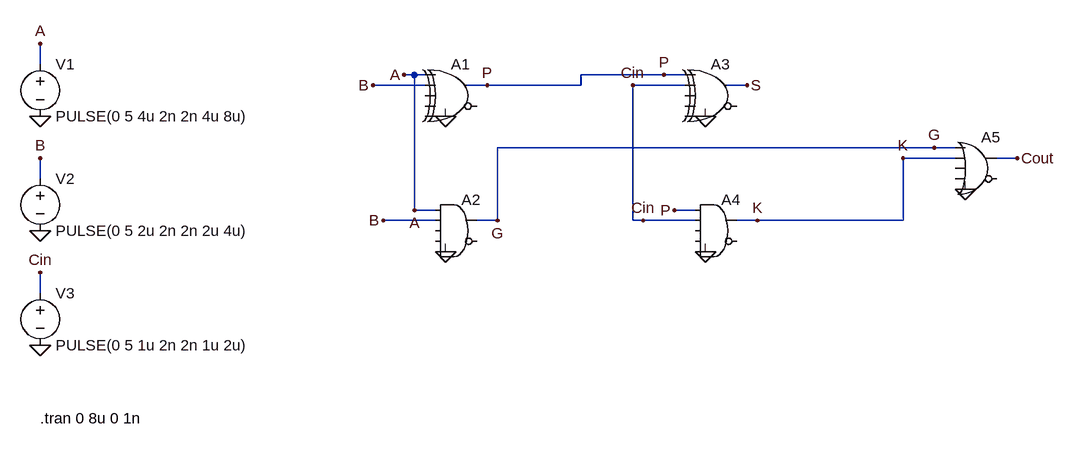
[diagram p0: schematic full_adder.asc]
full_adder.asc, the LTspice schematic file:
Version 4.1
SHEET 1 1904 784
WIRE -640 16 -640 -16
WIRE -64 32 -80 32
WIRE -48 32 -64 32
WIRE 320 32 192 32
WIRE 352 32 320 32
WIRE -48 48 -128 48
WIRE 48 48 16 48
WIRE 192 48 192 32
WIRE 192 48 48 48
WIRE 352 48 272 48
WIRE 448 48 416 48
WIRE 736 144 64 144
WIRE 768 144 736 144
WIRE 768 160 688 160
WIRE 864 160 832 160
WIRE -640 192 -640 160
WIRE -64 240 -64 32
WIRE -32 240 -64 240
WIRE 368 240 336 240
WIRE -32 256 -112 256
WIRE 64 256 64 144
WIRE 64 256 32 256
WIRE 272 256 272 48
WIRE 288 256 272 256
WIRE 368 256 288 256
WIRE 464 256 432 256
WIRE 688 256 688 160
WIRE 688 256 464 256
WIRE -640 368 -640 336
FLAG -640 -16 A
FLAG -640 96 0
FLAG -640 160 B
FLAG -640 272 0
FLAG -640 336 Cin
FLAG -640 448 0
FLAG -80 32 A
FLAG -128 48 B
FLAG -16 96 0
FLAG 48 48 P
FLAG -64 240 A
FLAG -112 256 B
FLAG -16 304 0
FLAG 64 256 G
FLAG 320 32 P
FLAG 272 48 Cin
FLAG 384 96 0
FLAG 448 48 S
FLAG 336 240 P
FLAG 288 256 Cin
FLAG 384 304 0
FLAG 464 256 K
FLAG 736 144 G
FLAG 688 160 K
FLAG 784 208 0
FLAG 864 160 Cout
SYMBOL voltage -640 0 R0
SYMATTR InstName V1
SYMATTR Value PULSE(0 5 4u 2n 2n 4u 8u)
SYMBOL voltage -640 176 R0
SYMATTR InstName V2
SYMATTR Value PULSE(0 5 2u 2n 2n 2u 4u)
SYMBOL voltage -640 352 R0
SYMATTR InstName V3
SYMATTR Value PULSE(0 5 1u 2n 2n 1u 2u)
SYMBOL Digital\\xor 0 0 R0
SYMATTR InstName A1
SYMATTR SpiceLine Vhigh=5 Vlow=0 Ref=2.5 Td=10n
SYMBOL Digital\\and 0 208 R0
SYMATTR InstName A2
SYMATTR SpiceLine Vhigh=5 Vlow=0 Ref=2.5 Td=10n
SYMBOL Digital\\xor 400 0 R0
SYMATTR InstName A3
SYMATTR SpiceLine Vhigh=5 Vlow=0 Ref=2.5 Td=10n
SYMBOL Digital\\and 400 208 R0
SYMATTR InstName A4
SYMATTR SpiceLine Vhigh=5 Vlow=0 Ref=2.5 Td=10n
SYMBOL Digital\\or 800 112 R0
SYMATTR InstName A5
SYMATTR SpiceLine Vhigh=5 Vlow=0 Ref=2.5 Td=10n
TEXT -640 560 Left 2 !.tran 0 8u 0 1n

The netlist it stands for:
* full_adder.asc
V1 A 0 PULSE(0 5 4u 2n 2n 4u 8u)
V2 B 0 PULSE(0 5 2u 2n 2n 2u 4u)
V3 Cin 0 PULSE(0 5 1u 2n 2n 1u 2u)
A1 A B 0 0 0 0 P 0 XOR Vhigh=5 Vlow=0 Ref=2.5 Td=10n
A2 A B 0 0 0 0 G 0 AND Vhigh=5 Vlow=0 Ref=2.5 Td=10n
A3 P Cin 0 0 0 0 S 0 XOR Vhigh=5 Vlow=0 Ref=2.5 Td=10n
A4 P Cin 0 0 0 0 K 0 AND Vhigh=5 Vlow=0 Ref=2.5 Td=10n
A5 G K 0 0 0 0 Cout 0 OR Vhigh=5 Vlow=0 Ref=2.5 Td=10n
.tran 0 8u 0 1n
.backanno
.end